# EAGLE design RTD2660_VGA12P_LVDS (EAGLE 7.7.0)
RTD2660 VGA(12P) -> LVDS 20P 2.0mm (7in 1024x600)

## Sheet 1 of 4
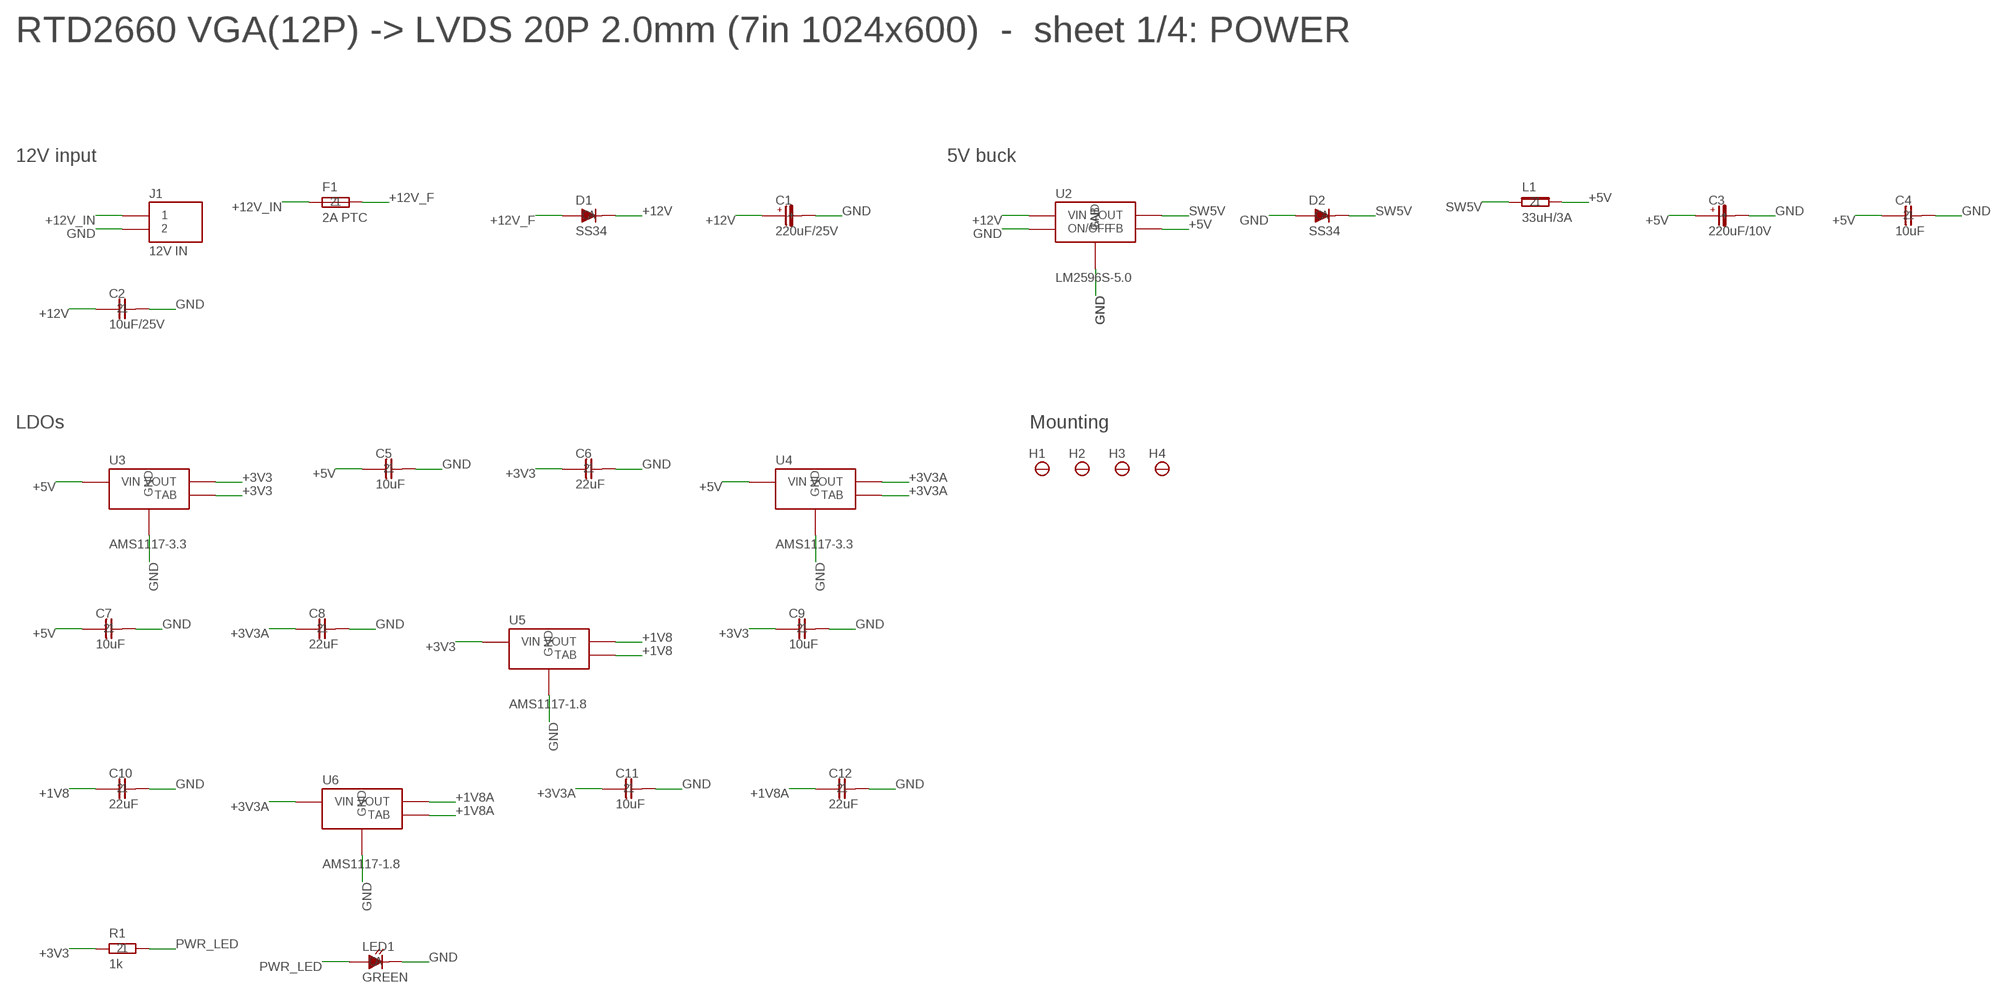
[diagram p0: schematic, sheet 1]

### Parts
C1  220uF/25V  CPOL-D8  [CPOL-D8]
C2  10uF/25V  C-1206  [1206]
C3  220uF/10V  CPOL-D8  [CPOL-D8]
C4  10uF  C-0805  [0805]
C5  10uF  C-0805  [0805]
C6  22uF  C-1206  [1206]
C7  10uF  C-0805  [0805]
C8  22uF  C-1206  [1206]
C9  10uF  C-0805  [0805]
C10  22uF  C-1206  [1206]
C11  10uF  C-0805  [0805]
C12  22uF  C-1206  [1206]
D1  SS34  D-SMA  [SMA]
D2  SS34  D-SMA  [SMA]
F1  2A PTC  FUSE-1206  [1206]
H1  M3  HOLE-M3  [HOLE3.2]
H2  M3  HOLE-M3  [HOLE3.2]
H3  M3  HOLE-M3  [HOLE3.2]
H4  M3  HOLE-M3  [HOLE3.2]
J1  12V IN  HDR-1X2  [HDR1X2-2.54]
L1  33uH/3A  L-12X12  [IND-12X12]
LED1  GREEN  LED-0603  [LED0603]
R1  1k  R-0603  [0603]
U2  LM2596S-5.0  LM2596S  [TO263-5]
U3  AMS1117-3.3  AMS1117  [SOT223]
U4  AMS1117-3.3  AMS1117  [SOT223]
U5  AMS1117-1.8  AMS1117  [SOT223]
U6  AMS1117-1.8  AMS1117  [SOT223]

### Nets
+1V8: C10.1 U5.2(VOUT) U5.4(TAB) ; also sheet 2
+1V8A: C12.1 U6.2(VOUT) U6.4(TAB) ; also sheet 2
+3V3: C6.1 C9.1 R1.1 U3.2(VOUT) U3.4(TAB) U5.3(VIN) ; also sheet 2,3
+3V3A: C8.1 C11.1 U4.2(VOUT) U4.4(TAB) U6.3(VIN) ; also sheet 2
+5V: C3.+ C4.1 C5.1 C7.1 L1.2 U2.4(FB) U3.3(VIN) U4.3(VIN) ; also sheet 3,4
+12V: C1.+ C2.1 D1.C U2.1(VIN) ; also sheet 4
+12V_F: D1.A F1.2
+12V_IN: F1.1 J1.1
GND: C1.- C2.2 C3.- C4.2 C5.2 C6.2 C7.2 C8.2 C9.2 C10.2 C11.2 C12.2 D2.A J1.2 LED1.C U2.3(GND) U2.5(ON/OFF) U2.6(TAB) U3.1(GND) U4.1(GND) U5.1(GND) U6.1(GND) ; also sheet 2,3,4
PWR_LED: LED1.A R1.2
SW5V: D2.C L1.1 U2.2(OUT)

### Notes on the sheet
- RTD2660 VGA(12P) -> LVDS 20P 2.0mm (7in 1024x600)  -  sheet 1/4: POWER
- 12V input | 5V buck
- LDOs | Mounting

## Sheet 2 of 4
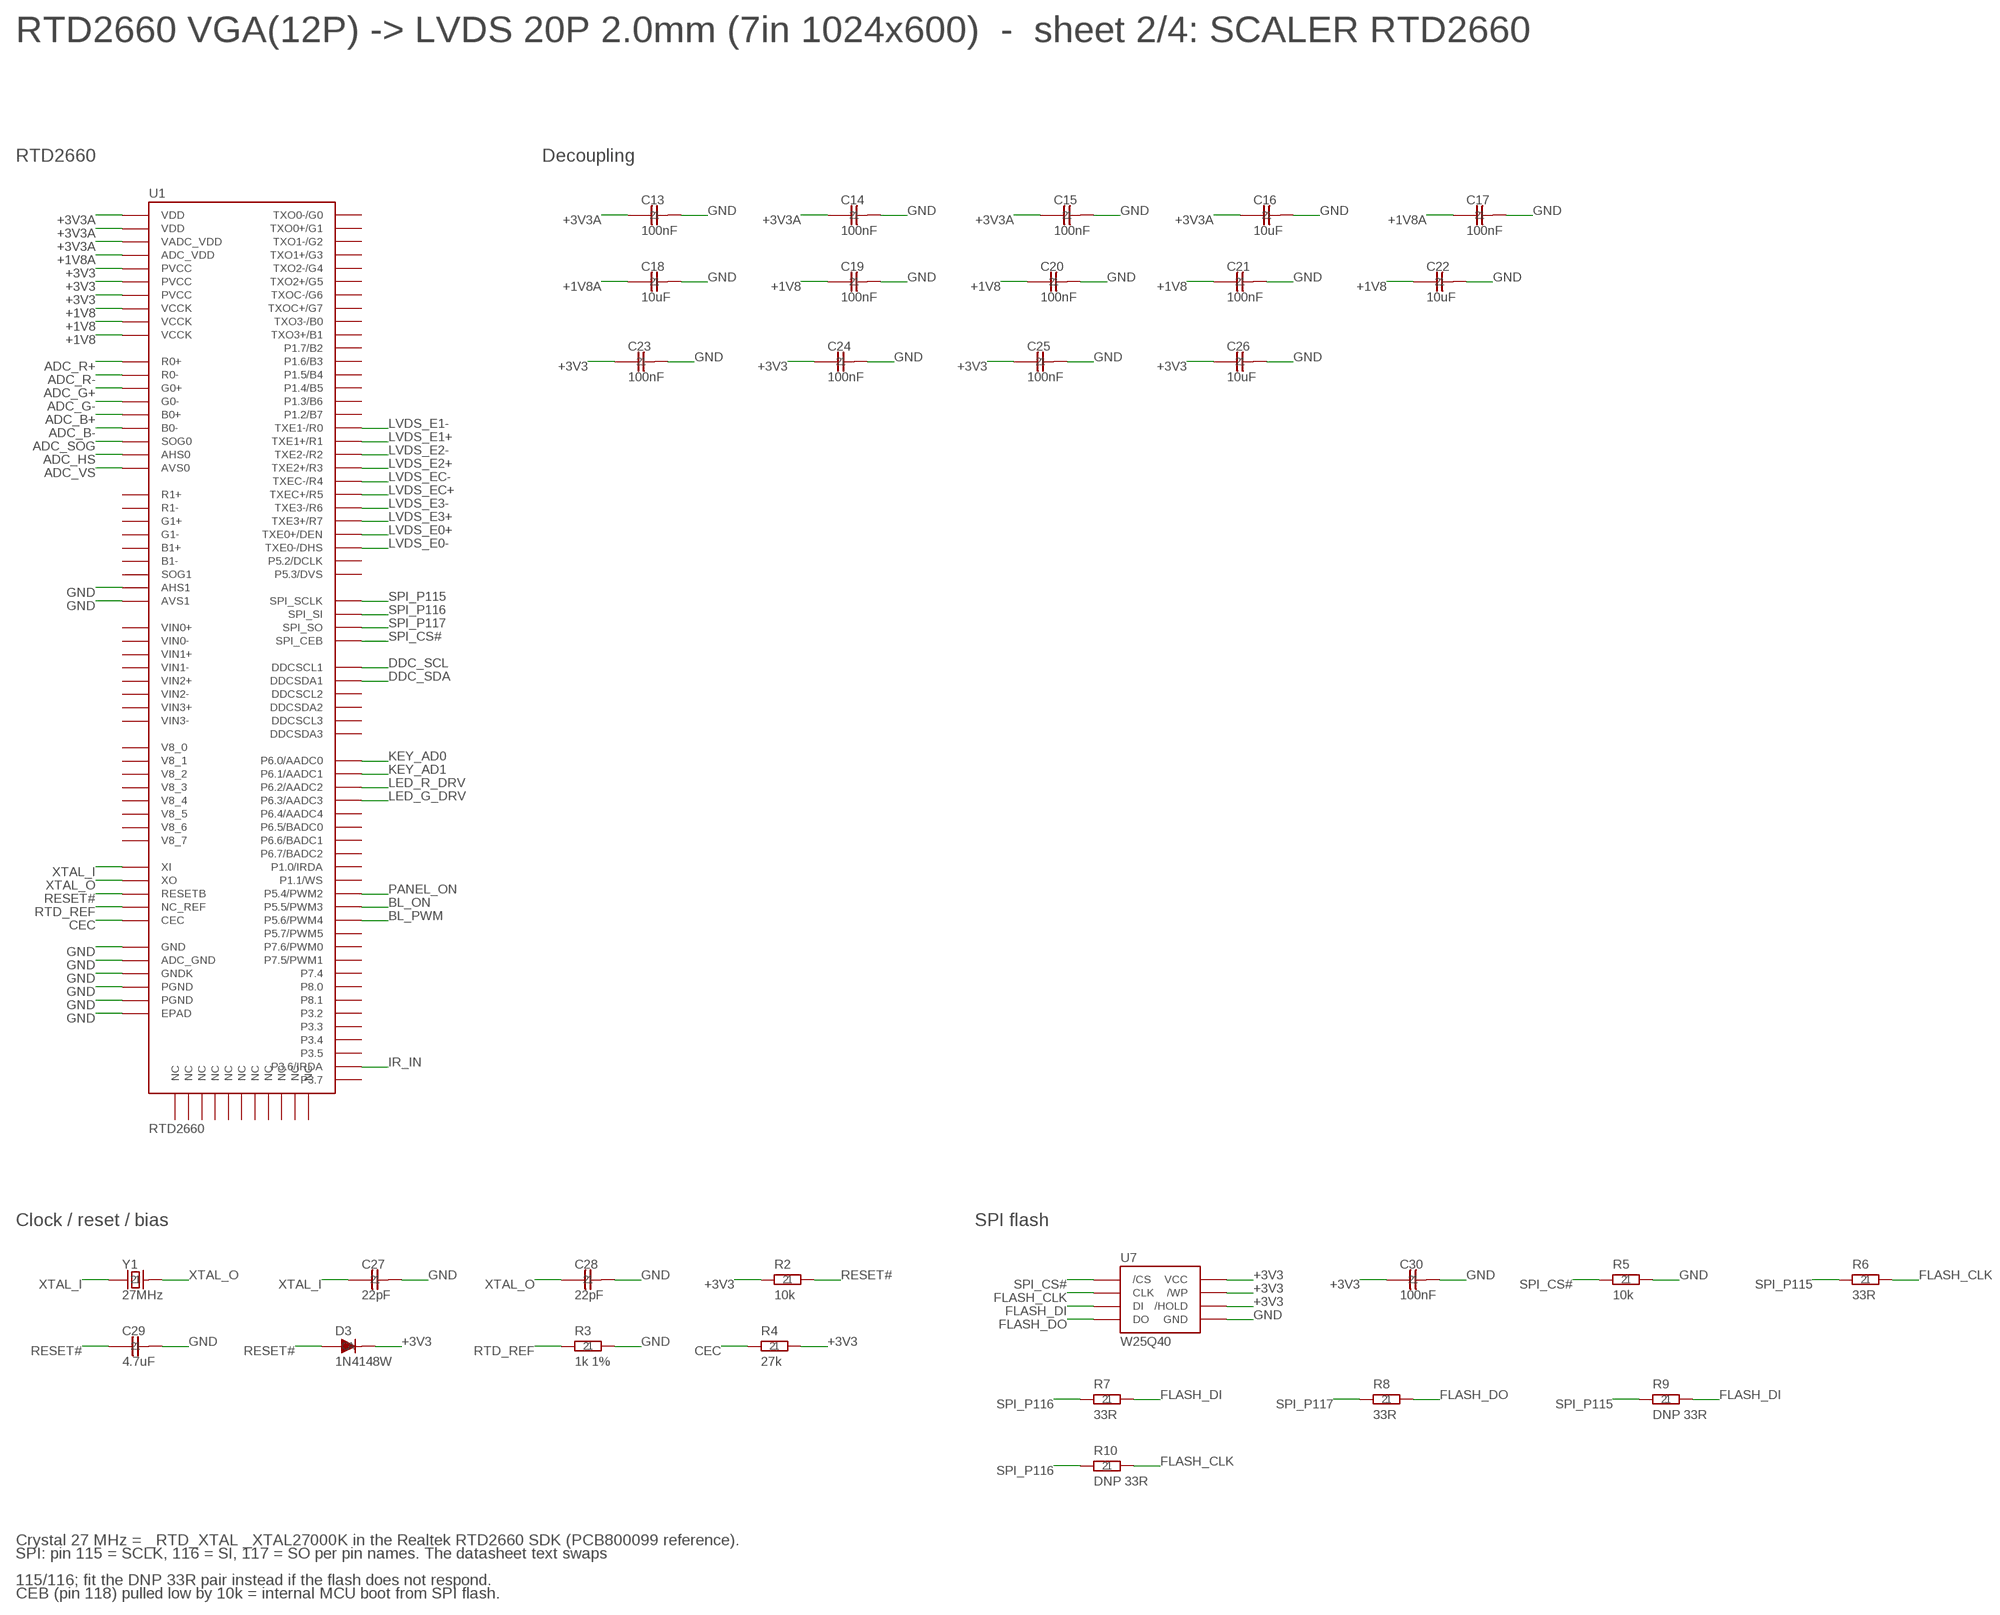
[diagram p1: schematic, sheet 2]

### Parts
C13  100nF  C-0603  [0603]
C14  100nF  C-0603  [0603]
C15  100nF  C-0603  [0603]
C16  10uF  C-0805  [0805]
C17  100nF  C-0603  [0603]
C18  10uF  C-0805  [0805]
C19  100nF  C-0603  [0603]
C20  100nF  C-0603  [0603]
C21  100nF  C-0603  [0603]
C22  10uF  C-0805  [0805]
C23  100nF  C-0603  [0603]
C24  100nF  C-0603  [0603]
C25  100nF  C-0603  [0603]
C26  10uF  C-0805  [0805]
C27  22pF  C-0603  [0603]
C28  22pF  C-0603  [0603]
C29  4.7uF  C-0805  [0805]
C30  100nF  C-0603  [0603]
D3  1N4148W  D-SOD123  [SOD123]
R2  10k  R-0603  [0603]
R3  1k 1%  R-0603  [0603]
R4  27k  R-0603  [0603]
R5  10k  R-0603  [0603]
R6  33R  R-0603  [0603]
R7  33R  R-0603  [0603]
R8  33R  R-0603  [0603]
R9  DNP 33R  R-0603  [0603]
R10  DNP 33R  R-0603  [0603]
U1  RTD2660  [LQFP128-14X20-EP]
U7  W25Q40  SPIFLASH-SOIC8  [SOIC8]
Y1  27MHz  XTAL-HC49SMD  [HC49SMD]

### Nets
+1V8: C19.1 C20.1 C21.1 C22.1 U1.60(VCCK) U1.73(VCCK) U1.120(VCCK) ; also sheet 1
+1V8A: C17.1 C18.1 U1.23(ADC_VDD) ; also sheet 1
+3V3: C23.1 C24.1 C25.1 C26.1 C30.1 D3.C R2.1 R4.2 U1.62(PVCC) U1.84(PVCC) U1.106(PVCC) U7.3(/WP) U7.7(/HOLD) U7.8(VCC) ; also sheet 1,3
+3V3A: C13.1 C14.1 C15.1 C16.1 U1.1(VDD) U1.20(VDD) U1.49(VADC_VDD) ; also sheet 1
ADC_B+: U1.25(B0+) ; also sheet 3
ADC_B-: U1.24(B0-) ; also sheet 3
ADC_G+: U1.27(G0+) ; also sheet 3
ADC_G-: U1.26(G0-) ; also sheet 3
ADC_HS: U1.22(AHS0) ; also sheet 3
ADC_R+: U1.30(R0+) ; also sheet 3
ADC_R-: U1.29(R0-) ; also sheet 3
ADC_SOG: U1.28(SOG0) ; also sheet 3
ADC_VS: U1.21(AVS0) ; also sheet 3
BL_ON: U1.99(P5.5/PWM3) ; also sheet 4
BL_PWM: U1.100(P5.6/PWM4) ; also sheet 4
CEC: R4.1 U1.126(CEC)
DDC_SCL: U1.58(DDCSCL1) ; also sheet 3
DDC_SDA: U1.59(DDCSDA1) ; also sheet 3
FLASH_CLK: R6.2 R10.2 U7.6(CLK)
FLASH_DI: R7.2 R9.2 U7.5(DI)
FLASH_DO: R8.2 U7.2(DO)
GND: C13.2 C14.2 C15.2 C16.2 C17.2 C18.2 C19.2 C20.2 C21.2 C22.2 C23.2 C24.2 C25.2 C26.2 C27.2 C28.2 C29.2 C30.2 R3.2 R5.2 U1.11(GND) U1.38(ADC_GND) U1.39(AHS1) U1.40(AVS1) U1.61(GNDK) U1.85(PGND) U1.107(PGND) U1.EP(EPAD) U7.4(GND) ; also sheet 1,3,4
IR_IN: U1.113(P3.6/IRDA) ; also sheet 3
KEY_AD0: U1.50(P6.0/AADC0) ; also sheet 3
KEY_AD1: U1.51(P6.1/AADC1) ; also sheet 3
LED_G_DRV: U1.53(P6.3/AADC3) ; also sheet 3
LED_R_DRV: U1.52(P6.2/AADC2) ; also sheet 3
LVDS_E0+: U1.94(TXE0+/DEN) ; also sheet 4
LVDS_E0-: U1.95(TXE0-/DHS) ; also sheet 4
LVDS_E1+: U1.92(TXE1+/R1) ; also sheet 4
LVDS_E1-: U1.93(TXE1-/R0) ; also sheet 4
LVDS_E2+: U1.90(TXE2+/R3) ; also sheet 4
LVDS_E2-: U1.91(TXE2-/R2) ; also sheet 4
LVDS_E3+: U1.86(TXE3+/R7) ; also sheet 4
LVDS_E3-: U1.87(TXE3-/R6) ; also sheet 4
LVDS_EC+: U1.88(TXEC+/R5) ; also sheet 4
LVDS_EC-: U1.89(TXEC-/R4) ; also sheet 4
PANEL_ON: U1.98(P5.4/PWM2) ; also sheet 4
RESET#: C29.1 D3.A R2.2 U1.125(RESETB)
RTD_REF: R3.1 U1.2(NC_REF)
SPI_CS#: R5.1 U1.118(SPI_CEB) U7.1(/CS)
SPI_P115: R6.1 R9.1 U1.115(SPI_SCLK)
SPI_P116: R7.1 R10.1 U1.116(SPI_SI)
SPI_P117: R8.1 U1.117(SPI_SO)
XTAL_I: C27.1 U1.128(XI) Y1.1
XTAL_O: C28.1 U1.127(XO) Y1.2
Unconnected: U1.3(V8_0) U1.4(V8_1) U1.5(V8_2) U1.6(V8_3) U1.7(V8_4) U1.8(V8_5) U1.9(V8_6) U1.10(V8_7) U1.12(NC) U1.13(NC) U1.14(NC) U1.15(NC) U1.16(NC) U1.17(NC) U1.18(NC) U1.19(NC) U1.31(B1-) U1.32(B1+) U1.33(G1-) U1.34(G1+) U1.35(SOG1) U1.36(R1-) U1.37(R1+) U1.41(VIN0+) U1.42(VIN0-) U1.43(VIN1+) U1.44(VIN1-) U1.45(VIN2+) U1.46(VIN2-) U1.47(VIN3+) U1.48(VIN3-) U1.54(P6.4/AADC4) U1.55(P6.5/BADC0) U1.56(P6.6/BADC1) U1.57(P6.7/BADC2) U1.63(NC) U1.64(P1.0/IRDA) U1.65(P1.1/WS) U1.66(P1.2/B7) U1.67(P1.3/B6) U1.68(P1.4/B5) U1.69(P1.5/B4) U1.70(P1.6/B3) U1.71(P1.7/B2) U1.72(NC) U1.74(TXO3+/B1) U1.75(TXO3-/B0) U1.76(TXOC+/G7) U1.77(TXOC-/G6) U1.78(TXO2+/G5) U1.79(TXO2-/G4) U1.80(TXO1+/G3) U1.81(TXO1-/G2) U1.82(TXO0+/G1) U1.83(TXO0-/G0) U1.96(P5.2/DCLK) U1.97(P5.3/DVS) U1.101(P5.7/PWM5) U1.102(P7.6/PWM0) U1.103(P7.5/PWM1) U1.104(P7.4) U1.105(P8.0) U1.108(P8.1) U1.109(P3.2) U1.110(P3.3) U1.111(P3.4) U1.112(P3.5) U1.114(P3.7) U1.119(NC) U1.121(DDCSCL3) U1.122(DDCSDA3) U1.123(DDCSDA2) U1.124(DDCSCL2)

### Notes on the sheet
- RTD2660 VGA(12P) -> LVDS 20P 2.0mm (7in 1024x600)  -  sheet 2/4: SCALER RTD2660
- RTD2660 | Decoupling
- Clock / reset / bias | SPI flash
- Crystal 27 MHz = _RTD_XTAL _XTAL27000K in the Realtek RTD2660 SDK (PCB800099 reference).
- SPI: pin 115 = SCLK, 116 = SI, 117 = SO per pin names. The datasheet text swaps
- 115/116; fit the DNP 33R pair instead if the flash does not respond.
- CEB (pin 118) pulled low by 10k = internal MCU boot from SPI flash.

## Sheet 3 of 4
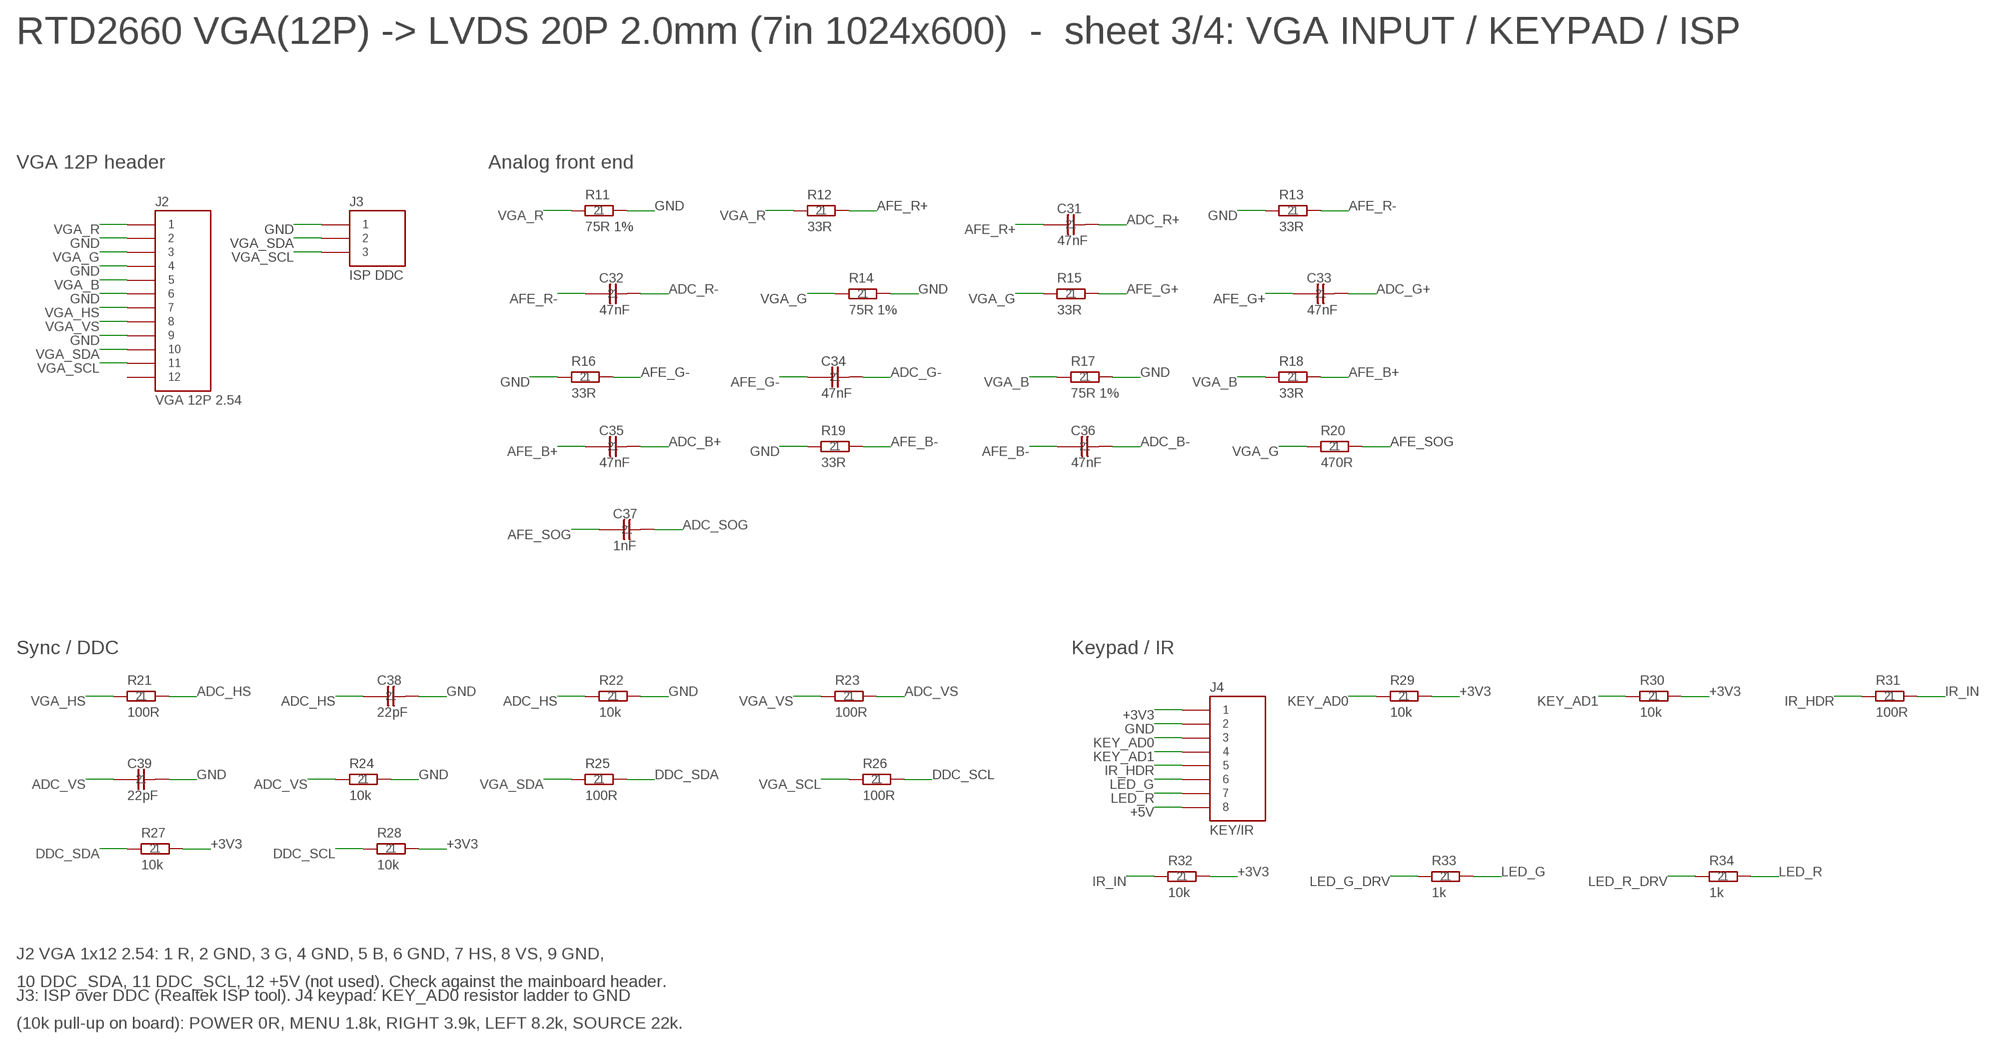
[diagram p2: schematic, sheet 3]

### Parts
C31  47nF  C-0603  [0603]
C32  47nF  C-0603  [0603]
C33  47nF  C-0603  [0603]
C34  47nF  C-0603  [0603]
C35  47nF  C-0603  [0603]
C36  47nF  C-0603  [0603]
C37  1nF  C-0603  [0603]
C38  22pF  C-0603  [0603]
C39  22pF  C-0603  [0603]
J2  VGA 12P 2.54  HDR-1X12  [HDR1X12-2.54]
J3  ISP DDC  HDR-1X3  [HDR1X3-2.54]
J4  KEY/IR  HDR-1X8  [HDR1X8-2.54]
R11  75R 1%  R-0603  [0603]
R12  33R  R-0603  [0603]
R13  33R  R-0603  [0603]
R14  75R 1%  R-0603  [0603]
R15  33R  R-0603  [0603]
R16  33R  R-0603  [0603]
R17  75R 1%  R-0603  [0603]
R18  33R  R-0603  [0603]
R19  33R  R-0603  [0603]
R20  470R  R-0603  [0603]
R21  100R  R-0603  [0603]
R22  10k  R-0603  [0603]
R23  100R  R-0603  [0603]
R24  10k  R-0603  [0603]
R25  100R  R-0603  [0603]
R26  100R  R-0603  [0603]
R27  10k  R-0603  [0603]
R28  10k  R-0603  [0603]
R29  10k  R-0603  [0603]
R30  10k  R-0603  [0603]
R31  100R  R-0603  [0603]
R32  10k  R-0603  [0603]
R33  1k  R-0603  [0603]
R34  1k  R-0603  [0603]

### Nets
+3V3: J4.1 R27.2 R28.2 R29.2 R30.2 R32.2 ; also sheet 1,2
+5V: J4.8 ; also sheet 1,4
ADC_B+: C35.2 ; also sheet 2
ADC_B-: C36.2 ; also sheet 2
ADC_G+: C33.2 ; also sheet 2
ADC_G-: C34.2 ; also sheet 2
ADC_HS: C38.1 R21.2 R22.1 ; also sheet 2
ADC_R+: C31.2 ; also sheet 2
ADC_R-: C32.2 ; also sheet 2
ADC_SOG: C37.2 ; also sheet 2
ADC_VS: C39.1 R23.2 R24.1 ; also sheet 2
AFE_B+: C35.1 R18.2
AFE_B-: C36.1 R19.2
AFE_G+: C33.1 R15.2
AFE_G-: C34.1 R16.2
AFE_R+: C31.1 R12.2
AFE_R-: C32.1 R13.2
AFE_SOG: C37.1 R20.2
DDC_SCL: R26.2 R28.1 ; also sheet 2
DDC_SDA: R25.2 R27.1 ; also sheet 2
GND: C38.2 C39.2 J2.2 J2.4 J2.6 J2.9 J3.1 J4.2 R11.2 R13.1 R14.2 R16.1 R17.2 R19.1 R22.2 R24.2 ; also sheet 1,2,4
IR_HDR: J4.5 R31.1
IR_IN: R31.2 R32.1 ; also sheet 2
KEY_AD0: J4.3 R29.1 ; also sheet 2
KEY_AD1: J4.4 R30.1 ; also sheet 2
LED_G: J4.6 R33.2
LED_G_DRV: R33.1 ; also sheet 2
LED_R: J4.7 R34.2
LED_R_DRV: R34.1 ; also sheet 2
VGA_B: J2.5 R17.1 R18.1
VGA_G: J2.3 R14.1 R15.1 R20.1
VGA_HS: J2.7 R21.1
VGA_R: J2.1 R11.1 R12.1
VGA_SCL: J2.11 J3.3 R26.1
VGA_SDA: J2.10 J3.2 R25.1
VGA_VS: J2.8 R23.1
Unconnected: J2.12

### Notes on the sheet
- RTD2660 VGA(12P) -> LVDS 20P 2.0mm (7in 1024x600)  -  sheet 3/4: VGA INPUT / KEYPAD / ISP
- VGA 12P header | Analog front end
- Sync / DDC | Keypad / IR
- J2 VGA 1x12 2.54: 1 R, 2 GND, 3 G, 4 GND, 5 B, 6 GND, 7 HS, 8 VS, 9 GND,
- 10 DDC_SDA, 11 DDC_SCL, 12 +5V (not used). Check against the mainboard header.
- J3: ISP over DDC (Realtek ISP tool). J4 keypad: KEY_AD0 resistor ladder to GND
- (10k pull-up on board): POWER 0R, MENU 1.8k, RIGHT 3.9k, LEFT 8.2k, SOURCE 22k.

## Sheet 4 of 4
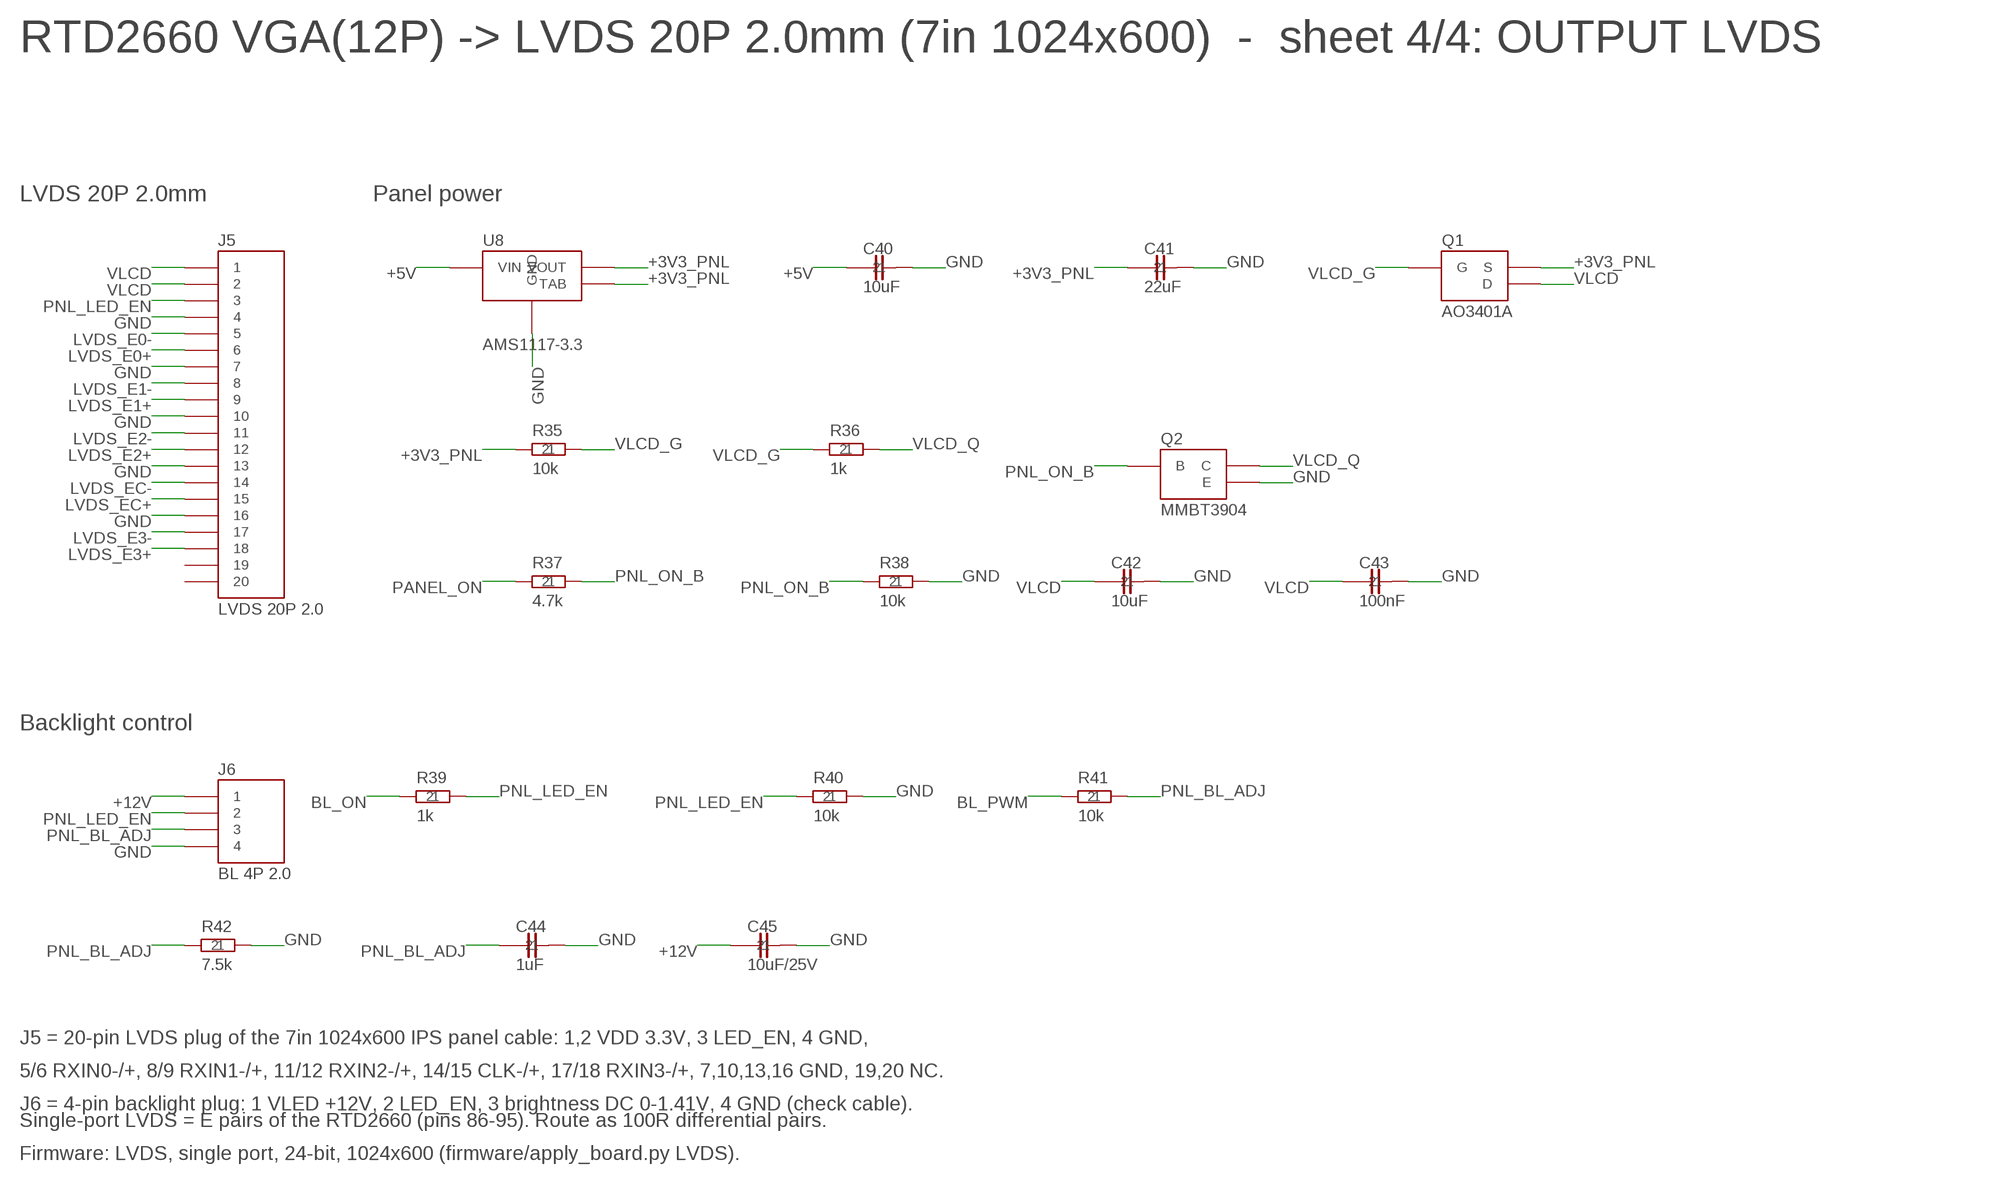
[diagram p3: schematic, sheet 4]

### Parts
C40  10uF  C-0805  [0805]
C41  22uF  C-1206  [1206]
C42  10uF  C-0805  [0805]
C43  100nF  C-0603  [0603]
C44  1uF  C-0603  [0603]
C45  10uF/25V  C-1206  [1206]
J5  LVDS 20P 2.0  HDR-1X20-2.0  [HDR1X20-2.0]
J6  BL 4P 2.0  HDR-1X4-2.0  [HDR1X4-2.0]
Q1  AO3401A  PMOS-SOT23  [SOT23]
Q2  MMBT3904  NPN-SOT23  [SOT23]
R35  10k  R-0603  [0603]
R36  1k  R-0603  [0603]
R37  4.7k  R-0603  [0603]
R38  10k  R-0603  [0603]
R39  1k  R-0603  [0603]
R40  10k  R-0603  [0603]
R41  10k  R-0603  [0603]
R42  7.5k  R-0603  [0603]
U8  AMS1117-3.3  AMS1117  [SOT223]

### Nets
+3V3_PNL: C41.1 Q1.2(S) R35.1 U8.2(VOUT) U8.4(TAB)
+5V: C40.1 U8.3(VIN) ; also sheet 1,3
+12V: C45.1 J6.1 ; also sheet 1
BL_ON: R39.1 ; also sheet 2
BL_PWM: R41.1 ; also sheet 2
GND: C40.2 C41.2 C42.2 C43.2 C44.2 C45.2 J5.4 J5.7 J5.10 J5.13 J5.16 J6.4 Q2.2(E) R38.2 R40.2 R42.2 U8.1(GND) ; also sheet 1,2,3
LVDS_E0+: J5.6 ; also sheet 2
LVDS_E0-: J5.5 ; also sheet 2
LVDS_E1+: J5.9 ; also sheet 2
LVDS_E1-: J5.8 ; also sheet 2
LVDS_E2+: J5.12 ; also sheet 2
LVDS_E2-: J5.11 ; also sheet 2
LVDS_E3+: J5.18 ; also sheet 2
LVDS_E3-: J5.17 ; also sheet 2
LVDS_EC+: J5.15 ; also sheet 2
LVDS_EC-: J5.14 ; also sheet 2
PANEL_ON: R37.1 ; also sheet 2
PNL_BL_ADJ: C44.1 J6.3 R41.2 R42.1
PNL_LED_EN: J5.3 J6.2 R39.2 R40.1
PNL_ON_B: Q2.1(B) R37.2 R38.1
VLCD: C42.1 C43.1 J5.1 J5.2 Q1.3(D)
VLCD_G: Q1.1(G) R35.2 R36.1
VLCD_Q: Q2.3(C) R36.2
Unconnected: J5.19 J5.20

### Notes on the sheet
- RTD2660 VGA(12P) -> LVDS 20P 2.0mm (7in 1024x600)  -  sheet 4/4: OUTPUT LVDS
- LVDS 20P 2.0mm | Panel power
- Backlight control
- J5 = 20-pin LVDS plug of the 7in 1024x600 IPS panel cable: 1,2 VDD 3.3V, 3 LED_EN, 4 GND,
- 5/6 RXIN0-/+, 8/9 RXIN1-/+, 11/12 RXIN2-/+, 14/15 CLK-/+, 17/18 RXIN3-/+, 7,10,13,16 GND, 19,20 NC.
- J6 = 4-pin backlight plug: 1 VLED +12V, 2 LED_EN, 3 brightness DC 0-1.41V, 4 GND (check cable).
- Single-port LVDS = E pairs of the RTD2660 (pins 86-95). Route as 100R differential pairs.
- Firmware: LVDS, single port, 24-bit, 1024x600 (firmware/apply_board.py LVDS).

## Library data of the parts
C1 C3 = rtd2660_board:CPOL-D8: Electrolytic capacitor, radial D8
C2 C6 C8 C10 C12 C41 C45 = rtd2660_board:C-1206: Ceramic capacitor 1206
C4 C5 C7 C9 C11 C16 C18 C22 C26 C29 C40 C42 = rtd2660_board:C-0805: Ceramic capacitor 0805
C13-C15 C17 C19-C21 C23-C25 C27 C28 C30-C39 C43 C44 = rtd2660_board:C-0603: Ceramic capacitor 0603
D1 D2 = rtd2660_board:D-SMA: Schottky diode SMA (SS34)
D3 = rtd2660_board:D-SOD123: Diode SOD-123
F1 = rtd2660_board:FUSE-1206: Resettable fuse 1206
H1-H4 = rtd2660_board:HOLE-M3: M3 mounting hole
J1 = rtd2660_board:HDR-1X2: 1 x 2 pin header 2.54 mm
J2 = rtd2660_board:HDR-1X12: 1 x 12 pin header 2.54 mm
J3 = rtd2660_board:HDR-1X3: 1 x 3 pin header 2.54 mm
J4 = rtd2660_board:HDR-1X8: 1 x 8 pin header 2.54 mm
J5 = rtd2660_board:HDR-1X20-2.0: 1 x 20 pin header 2.0 mm, LVDS panel connector
J6 = rtd2660_board:HDR-1X4-2.0: 1 x 4 pin header 2.0 mm, backlight
L1 = rtd2660_board:L-12X12: Power inductor 12 x 12 mm
LED1 = rtd2660_board:LED-0603: LED 0603
Q1 = rtd2660_board:PMOS-SOT23: P-channel MOSFET SOT-23 (AO3401A / AO3407A)
Q2 = rtd2660_board:NPN-SOT23: NPN transistor SOT-23 (MMBT3904)
R1-R42 = rtd2660_board:R-0603: Resistor 0603
U1 = rtd2660_board:RTD2660: Realtek RTD2660 flat panel display controller, 128-pin E-PAD LQFP 14 x 20 mm
U2 = rtd2660_board:LM2596S: LM2596S buck regulator, TO-263-5 (tab = GND)
U3-U6 U8 = rtd2660_board:AMS1117: AMS1117 LDO, SOT-223 (tab = VOUT)
U7 = rtd2660_board:SPIFLASH-SOIC8: SPI NOR flash 25-series, SOIC-8 (W25Q40 / MX25L4006)
Y1 = rtd2660_board:XTAL-HC49SMD: Crystal HC-49/US SMD

## Board
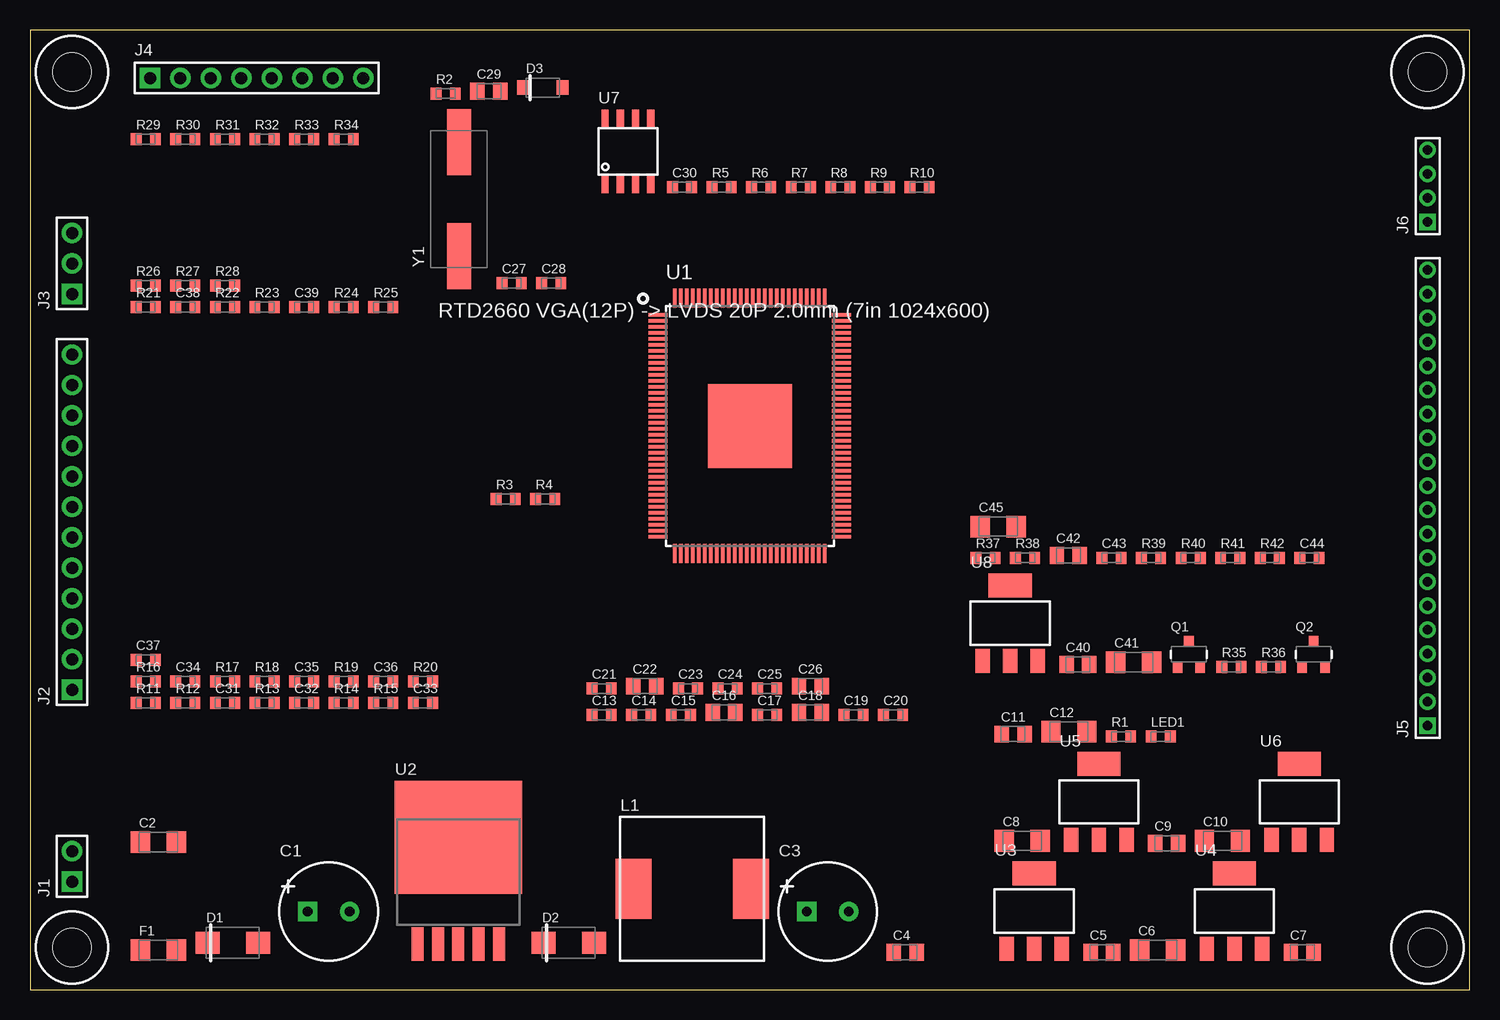
[diagram p4: board, top side]
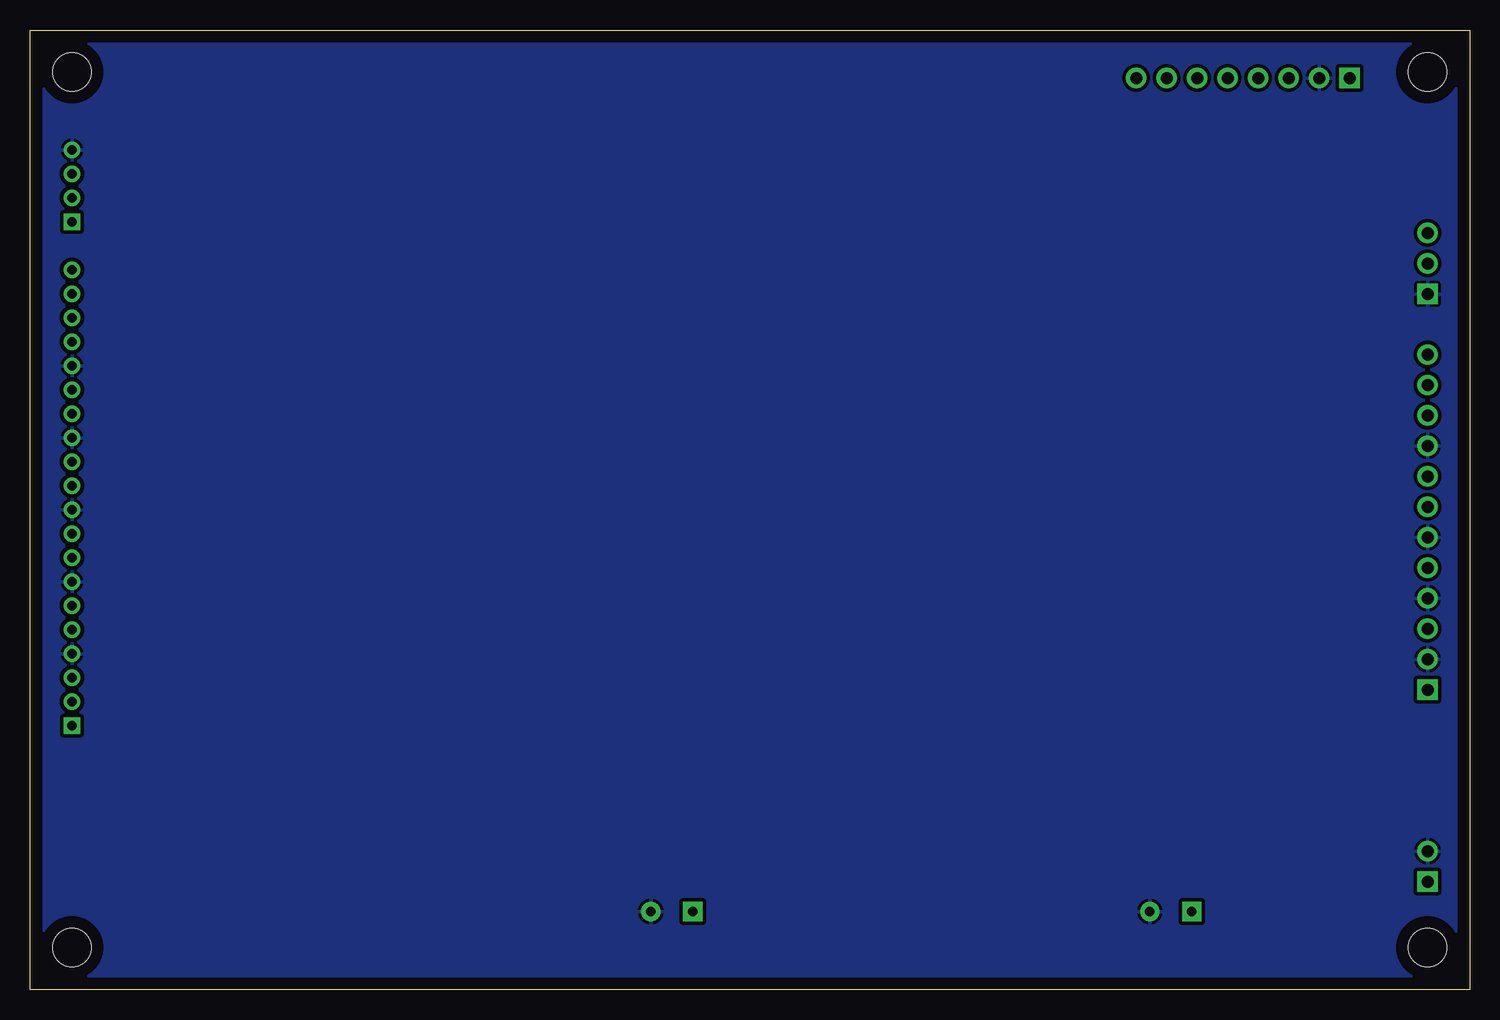
[diagram p5: board, bottom side, seen from below]

Size 120 x 80 mm. Coordinates in mm from the lower left corner, seen from the top.
Outline: 0,0 120,0 120,80 0,80 0,0
Copper layers used: Bottom

### Footprints (pad centres in the part's own frame; a part is rotated, then mirrored left to right if it is on the bottom)
CPOL-D8 = drill 0.8 pad 1.6 square: + -1.75,0 | drill 0.8 pad 1.6 round: - 1.75,0
1206 = smd 1.6 x 1.8: 1 -1.5,0; 2 1.5,0
0805 = smd 1.2 x 1.4: 1 -0.95,0; 2 0.95,0
0603 = smd 0.9 x 1: 1 -0.8,0; 2 0.8,0
SMA = smd 2 x 1.8: A 2.1,0; C -2.1,0
SOD123 = smd 1 x 1.2: A 1.65,0; C -1.65,0
HOLE3.2 = hole 3.2: 0,0
HDR1X2-2.54 = drill 1 pad 1.7 square: 1 0,0 | drill 1 pad 1.7 round: 2 2.54,0
HDR1X12-2.54 = drill 1 pad 1.7 square: 1 0,0 | drill 1 pad 1.7 round: 2 2.54,0; 3 5.08,0; 4 7.62,0; 5 10.16,0; 6 12.7,0; 7 15.24,0; 8 17.78,0; 9 20.32,0; 10 22.86,0; 11 25.4,0; 12 27.94,0
HDR1X3-2.54 = drill 1 pad 1.7 square: 1 0,0 | drill 1 pad 1.7 round: 2 2.54,0; 3 5.08,0
HDR1X8-2.54 = drill 1 pad 1.7 square: 1 0,0 | drill 1 pad 1.7 round: 2 2.54,0; 3 5.08,0; 4 7.62,0; 5 10.16,0; 6 12.7,0; 7 15.24,0; 8 17.78,0
HDR1X20-2.0 = drill 0.8 pad 1.4 square: 1 0,0 | drill 0.8 pad 1.4 round: 2 2,0; 3 4,0; 4 6,0; 5 8,0; 6 10,0; 7 12,0; 8 14,0; 9 16,0; 10 18,0; 11 20,0; 12 22,0; 13 24,0; 14 26,0; 15 28,0; 16 30,0; 17 32,0; 18 34,0; 19 36,0; 20 38,0
HDR1X4-2.0 = drill 0.8 pad 1.4 square: 1 0,0 | drill 0.8 pad 1.4 round: 2 2,0; 3 4,0; 4 6,0
IND-12X12 = smd 3 x 5: 1 -4.9,0; 2 4.9,0
LED0603 = smd 0.9 x 1: A 0.8,0; C -0.8,0
SOT23 = smd 0.8 x 0.9: 1 -0.95,-1.1; 2 0.95,-1.1; 3 0,1.1
LQFP128-14X20-EP = smd 1.6 x 0.28: 1 -7.65,9.25; 2 -7.65,8.75; 3 -7.65,8.25; 4 -7.65,7.75; 5 -7.65,7.25; 6 -7.65,6.75; 7 -7.65,6.25; 8 -7.65,5.75; 9 -7.65,5.25; 10 -7.65,4.75; 11 -7.65,4.25; 12 -7.65,3.75; 13 -7.65,3.25; 14 -7.65,2.75; 15 -7.65,2.25; 16 -7.65,1.75; 17 -7.65,1.25; 18 -7.65,0.75; 19 -7.65,0.25; 20 -7.65,-0.25; 21 -7.65,-0.75; 22 -7.65,-1.25; 23 -7.65,-1.75; 24 -7.65,-2.25; 25 -7.65,-2.75; 26 -7.65,-3.25; 27 -7.65,-3.75; 28 -7.65,-4.25; 29 -7.65,-4.75; 30 -7.65,-5.25; 31 -7.65,-5.75; 32 -7.65,-6.25; 33 -7.65,-6.75; 34 -7.65,-7.25; 35 -7.65,-7.75; 36 -7.65,-8.25; 37 -7.65,-8.75; 38 -7.65,-9.25; 65 7.65,-9.25; 66 7.65,-8.75; 67 7.65,-8.25; 68 7.65,-7.75; 69 7.65,-7.25; 70 7.65,-6.75; 71 7.65,-6.25; 72 7.65,-5.75; 73 7.65,-5.25; 74 7.65,-4.75; 75 7.65,-4.25; 76 7.65,-3.75; 77 7.65,-3.25; 78 7.65,-2.75; 79 7.65,-2.25; 80 7.65,-1.75; 81 7.65,-1.25; 82 7.65,-0.75; 83 7.65,-0.25; 84 7.65,0.25; 85 7.65,0.75; 86 7.65,1.25; 87 7.65,1.75; 88 7.65,2.25; 89 7.65,2.75; 90 7.65,3.25; 91 7.65,3.75; 92 7.65,4.25; 93 7.65,4.75; 94 7.65,5.25; 95 7.65,5.75; 96 7.65,6.25; 97 7.65,6.75; 98 7.65,7.25; 99 7.65,7.75; 100 7.65,8.25; 101 7.65,8.75; 102 7.65,9.25 | smd 0.28 x 1.6: 39 -6.25,-10.65; 40 -5.75,-10.65; 41 -5.25,-10.65; 42 -4.75,-10.65; 43 -4.25,-10.65; 44 -3.75,-10.65; 45 -3.25,-10.65; 46 -2.75,-10.65; 47 -2.25,-10.65; 48 -1.75,-10.65; 49 -1.25,-10.65; 50 -0.75,-10.65; 51 -0.25,-10.65; 52 0.25,-10.65; 53 0.75,-10.65; 54 1.25,-10.65; 55 1.75,-10.65; 56 2.25,-10.65; 57 2.75,-10.65; 58 3.25,-10.65; 59 3.75,-10.65; 60 4.25,-10.65; 61 4.75,-10.65; 62 5.25,-10.65; 63 5.75,-10.65; 64 6.25,-10.65; 103 6.25,10.65; 104 5.75,10.65; 105 5.25,10.65; 106 4.75,10.65; 107 4.25,10.65; 108 3.75,10.65; 109 3.25,10.65; 110 2.75,10.65; 111 2.25,10.65; 112 1.75,10.65; 113 1.25,10.65; 114 0.75,10.65; 115 0.25,10.65; 116 -0.25,10.65; 117 -0.75,10.65; 118 -1.25,10.65; 119 -1.75,10.65; 120 -2.25,10.65; 121 -2.75,10.65; 122 -3.25,10.65; 123 -3.75,10.65; 124 -4.25,10.65; 125 -4.75,10.65; 126 -5.25,10.65; 127 -5.75,10.65; 128 -6.25,10.65 | smd 7 x 7: EP 0,0
TO263-5 = smd 1 x 2.8: 1 -3.4,-6.5; 2 -1.7,-6.5; 3 0,-6.5; 4 1.7,-6.5; 5 3.4,-6.5 | smd 10.6 x 9.4: 6 0,2.4
SOT223 = smd 1.2 x 2: 1 -2.3,-3.15; 2 0,-3.15; 3 2.3,-3.15 | smd 3.6 x 2: 4 0,3.15
SOIC8 = smd 0.6 x 1.55: 1 -1.905,-2.7; 2 -0.635,-2.7; 3 0.635,-2.7; 4 1.905,-2.7; 5 1.905,2.7; 6 0.635,2.7; 7 -0.635,2.7; 8 -1.905,2.7
HC49SMD = smd 5.5 x 2: 1 -4.75,0; 2 4.75,0

### Placement (x,y rotation side)
C1  24.9,6.5 0 top
C2  10.7,12.3 0 top
C3  66.5,6.5 0 top
C4  72.95,3.1 0 top
C5  89.35,3.1 0 top
C6  94,3.3 0 top
C7  106.05,3.1 0 top
C8  82.7,12.4 0 top
C9  94.75,12.2 0 top
C10  99.4,12.4 0 top
C11  81.95,21.3 0 top
C12  86.6,21.5 0 top
C13  47.65,22.9 0 top
C14  50.95,22.9 0 top
C15  54.25,22.9 0 top
C16  57.85,23.1 0 top
C17  61.45,22.9 0 top
C18  65.05,23.1 0 top
C19  68.65,22.9 0 top
C20  71.95,22.9 0 top
C21  47.65,25.1 0 top
C22  51.25,25.3 0 top
C23  54.85,25.1 0 top
C24  58.15,25.1 0 top
C25  61.45,25.1 0 top
C26  65.05,25.3 0 top
C27  40.15,58.9 0 top
C28  43.45,58.9 0 top
C29  38.25,74.9 0 top
C30  54.35,66.9 0 top
C31  16.25,23.9 0 top
C32  22.85,23.9 0 top
C33  32.75,23.9 0 top
C34  12.95,25.7 0 top
C35  22.85,25.7 0 top
C36  29.45,25.7 0 top
C37  9.65,27.5 0 top
C38  12.95,56.9 0 top
C39  22.85,56.9 0 top
C40  87.35,27.1 0 top
C41  92,27.3 0 top
C42  86.55,36.2 0 top
C43  90.15,36 0 top
C44  106.65,36 0 top
C45  80.7,38.6 0 top
D1  16.9,3.9 0 top
D2  44.9,3.9 0 top
D3  42.75,75.2 0 top
F1  10.7,3.3 0 top
H1  3.5,3.5 0 top
H2  116.5,3.5 0 top
H3  3.5,76.5 0 top
H4  116.5,76.5 0 top
J1  3.5,9 90 top
J2  3.5,25 90 top
J3  3.5,58 90 top
J4  10,76 0 top
J5  116.5,22 90 top
J6  116.5,64 90 top
L1  55.2,8.4 0 top
LED1  94.25,21.1 0 top
Q1  96.6,27.95 0 top
Q2  107,27.95 0 top
R1  90.95,21.1 0 top
R2  34.65,74.7 0 top
R3  39.65,40.9 0 top
R4  42.95,40.9 0 top
R5  57.65,66.9 0 top
R6  60.95,66.9 0 top
R7  64.25,66.9 0 top
R8  67.55,66.9 0 top
R9  70.85,66.9 0 top
R10  74.15,66.9 0 top
R11  9.65,23.9 0 top
R12  12.95,23.9 0 top
R13  19.55,23.9 0 top
R14  26.15,23.9 0 top
R15  29.45,23.9 0 top
R16  9.65,25.7 0 top
R17  16.25,25.7 0 top
R18  19.55,25.7 0 top
R19  26.15,25.7 0 top
R20  32.75,25.7 0 top
R21  9.65,56.9 0 top
R22  16.25,56.9 0 top
R23  19.55,56.9 0 top
R24  26.15,56.9 0 top
R25  29.45,56.9 0 top
R26  9.65,58.7 0 top
R27  12.95,58.7 0 top
R28  16.25,58.7 0 top
R29  9.65,70.9 0 top
R30  12.95,70.9 0 top
R31  16.25,70.9 0 top
R32  19.55,70.9 0 top
R33  22.85,70.9 0 top
R34  26.15,70.9 0 top
R35  100.15,26.9 0 top
R36  103.45,26.9 0 top
R37  79.65,36 0 top
R38  82.95,36 0 top
R39  93.45,36 0 top
R40  96.75,36 0 top
R41  100.05,36 0 top
R42  103.35,36 0 top
U1  60,47 0 top
U2  35.7,10.3 0 top
U3  83.7,6.55 0 top
U4  100.4,6.55 0 top
U5  89.1,15.65 0 top
U6  105.8,15.65 0 top
U7  49.85,69.88 0 top
U8  81.7,30.55 0 top
Y1  35.75,65.9 90 top

### Tracks (layer width: path | path; a pad name or v marks a point on that pad's centre or on a via)
GND
  pour Bottom (isolate 0.305): 0.5,0.5 119.5,0.5 119.5,79.5 0.5,79.5

### Text on the board
tPlace: RTD2660 VGA(12P) -> LVDS 20P 2.0mm (7in 1024x600)